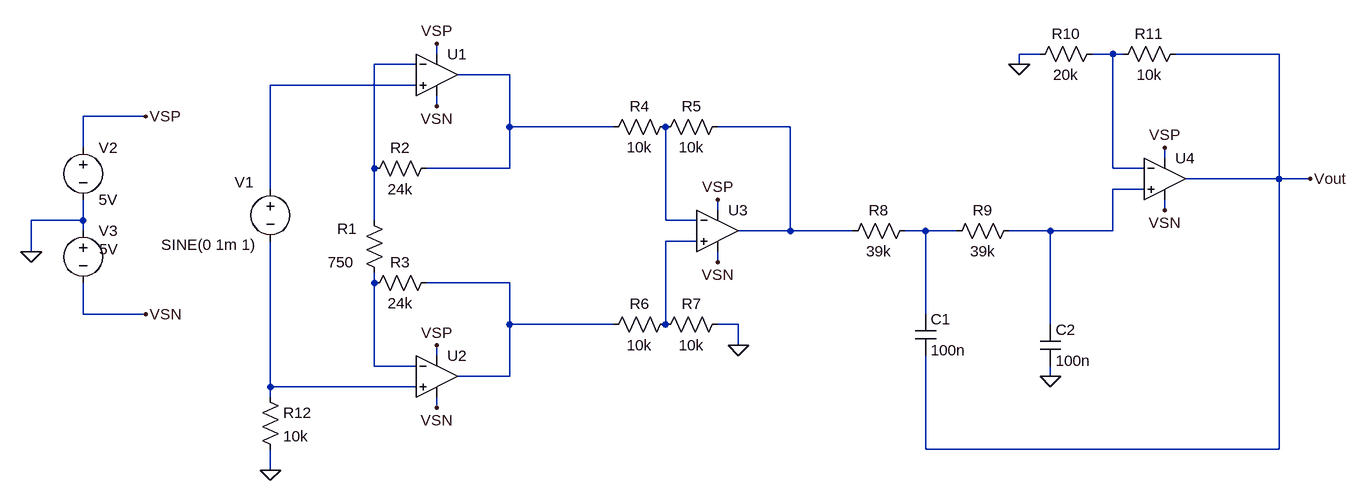
[diagram p0: schematic Schema_1.asc]
Schema_1.asc, the LTspice schematic file:
Version 4
SHEET 1 2040 680
WIRE 624 -48 624 -64
WIRE 1552 -48 1520 -48
WIRE 1664 -48 1632 -48
WIRE 1680 -48 1664 -48
WIRE 1920 -48 1760 -48
WIRE 592 -32 528 -32
WIRE 1520 -32 1520 -48
WIRE 736 -16 656 -16
WIRE 592 0 368 0
WIRE 624 32 624 16
WIRE 176 48 80 48
WIRE 736 64 736 -16
WIRE 896 64 736 64
WIRE 1168 64 1056 64
WIRE 80 96 80 48
WIRE 1744 112 1744 96
WIRE 528 128 528 -32
WIRE 736 128 736 64
WIRE 736 128 608 128
WIRE 1664 128 1664 -48
WIRE 1712 128 1664 128
WIRE 1920 144 1920 -48
WIRE 1920 144 1776 144
WIRE 1968 144 1920 144
WIRE 368 160 368 0
WIRE 1712 160 1664 160
WIRE 1056 192 1056 176
WIRE 1744 192 1744 176
WIRE 80 208 80 176
WIRE 80 208 0 208
WIRE 528 208 528 128
WIRE 976 208 976 64
WIRE 1024 208 976 208
WIRE 80 224 80 208
WIRE 1168 224 1168 64
WIRE 1168 224 1088 224
WIRE 1264 224 1168 224
WIRE 1376 224 1344 224
WIRE 1424 224 1376 224
WIRE 1568 224 1504 224
WIRE 1664 224 1664 160
WIRE 1664 224 1568 224
WIRE 1024 240 976 240
WIRE 0 256 0 208
WIRE 1056 272 1056 256
WIRE 528 304 528 288
WIRE 736 304 608 304
WIRE 80 352 80 304
WIRE 176 352 80 352
WIRE 1376 352 1376 224
WIRE 736 368 736 304
WIRE 896 368 736 368
WIRE 976 368 976 240
WIRE 1088 368 1056 368
WIRE 1568 368 1568 224
WIRE 1088 400 1088 368
WIRE 624 416 624 400
WIRE 528 432 528 304
WIRE 592 432 528 432
WIRE 736 448 736 368
WIRE 736 448 656 448
WIRE 1568 448 1568 432
WIRE 368 464 368 240
WIRE 592 464 368 464
WIRE 368 480 368 464
WIRE 624 496 624 480
WIRE 1376 560 1376 416
WIRE 1920 560 1920 144
WIRE 1920 560 1376 560
WIRE 368 592 368 560
FLAG 0 256 0
FLAG 176 48 VSP
FLAG 176 352 VSN
FLAG 368 592 0
FLAG 624 -64 VSP
FLAG 624 32 VSN
FLAG 624 400 VSP
FLAG 624 496 VSN
FLAG 1056 272 VSN
FLAG 1056 176 VSP
FLAG 1088 400 0
FLAG 1520 -32 0
FLAG 1744 192 VSN
FLAG 1744 96 VSP
FLAG 1968 144 Vout
FLAG 1568 448 0
SYMBOL voltage 80 208 R0
WINDOW 3 39 44 Center 2
WINDOW 123 0 0 Left 0
WINDOW 39 0 0 Left 0
SYMATTR InstName V3
SYMATTR Value 5V
SYMBOL voltage 80 80 R0
WINDOW 123 0 0 Left 0
WINDOW 39 0 0 Left 0
SYMATTR InstName V2
SYMATTR Value 5V
SYMBOL voltage 368 144 R0
WINDOW 0 -55 5 Left 2
WINDOW 3 -22 101 Right 2
WINDOW 123 0 0 Left 0
WINDOW 39 0 0 Left 0
SYMATTR InstName V1
SYMATTR Value SINE(0 1m 1)
SYMBOL res 352 464 R0
SYMATTR InstName R12
SYMATTR Value 10k
SYMBOL OpAmps\\UniversalOpAmp2 624 -16 R0
SYMATTR InstName U1
SYMBOL OpAmps\\UniversalOpAmp2 624 448 R0
SYMATTR InstName U2
SYMBOL res 512 192 R0
WINDOW 0 -41 29 Left 2
WINDOW 3 -56 80 Left 2
SYMATTR InstName R1
SYMATTR Value 750
SYMBOL res 512 320 R270
WINDOW 0 32 56 VTop 2
WINDOW 3 0 56 VBottom 2
SYMATTR InstName R3
SYMATTR Value 24k
SYMBOL res 624 112 R90
WINDOW 0 0 56 VBottom 2
WINDOW 3 32 56 VTop 2
SYMATTR InstName R2
SYMATTR Value 24k
SYMBOL res 992 48 R90
WINDOW 0 0 56 VBottom 2
WINDOW 3 32 56 VTop 2
SYMATTR InstName R4
SYMATTR Value 10k
SYMBOL res 992 352 R90
WINDOW 0 0 56 VBottom 2
WINDOW 3 32 56 VTop 2
SYMATTR InstName R6
SYMATTR Value 10k
SYMBOL OpAmps\\UniversalOpAmp2 1056 224 R0
SYMATTR InstName U3
SYMBOL res 1072 48 R90
WINDOW 0 0 56 VBottom 2
WINDOW 3 32 56 VTop 2
SYMATTR InstName R5
SYMATTR Value 10k
SYMBOL res 1072 352 R90
WINDOW 0 0 56 VBottom 2
WINDOW 3 32 56 VTop 2
SYMATTR InstName R7
SYMATTR Value 10k
SYMBOL res 1360 208 R90
WINDOW 0 0 56 VBottom 2
WINDOW 3 32 56 VTop 2
SYMATTR InstName R8
SYMATTR Value 39k
SYMBOL res 1520 208 R90
WINDOW 0 0 56 VBottom 2
WINDOW 3 32 56 VTop 2
SYMATTR InstName R9
SYMATTR Value 39k
SYMBOL cap 1360 352 R0
SYMATTR InstName C1
SYMATTR Value 100n
SYMBOL res 1648 -64 R90
WINDOW 0 0 56 VBottom 2
WINDOW 3 32 56 VTop 2
SYMATTR InstName R10
SYMATTR Value 20k
SYMBOL res 1776 -64 R90
WINDOW 0 0 56 VBottom 2
WINDOW 3 32 56 VTop 2
SYMATTR InstName R11
SYMATTR Value 10k
SYMBOL OpAmps\\UniversalOpAmp2 1744 144 R0
SYMATTR InstName U4
SYMBOL cap 1552 368 R0
SYMATTR InstName C2
SYMATTR Value 100n

The netlist it stands for:
* Schema_1.asc
V3 0 VSN 5V
V2 VSP 0 5V
V1 N004 N012 SINE(0 1m 1)
R12 N012 0 10k
XU1 N004 N002 VSP VSN N003 level2 Avol=1Meg GBW=10Meg Slew=10Meg Ilimit=25m Rail=0 Vos=0 En=0 Enk=0 In=0 Ink=0 Rin=500Meg  ; pins In+ In- V+ V- OUT
XU2 N012 N010 VSP VSN N011 level2 Avol=1Meg GBW=10Meg Slew=10Meg Ilimit=25m Rail=0 Vos=0 En=0 Enk=0 In=0 Ink=0 Rin=500Meg  ; pins In+ In- V+ V- OUT
R1 N002 N010 750
R3 N010 N011 24k
R2 N003 N002 24k
R4 N007 N003 10k
R6 N009 N011 10k
XU3 N009 N007 VSP VSN N005 level2 Avol=1Meg GBW=10Meg Slew=10Meg Ilimit=25m Rail=0 Vos=0 En=0 Enk=0 In=0 Ink=0 Rin=500Meg  ; pins In+ In- V+ V- OUT
R5 N005 N007 10k
R7 0 N009 10k
R8 N008 N005 39k
R9 N006 N008 39k
C1 N008 Vout 100n
R10 N001 0 20k
R11 Vout N001 10k
XU4 N006 N001 VSP VSN Vout level2 Avol=1Meg GBW=10Meg Slew=10Meg Ilimit=25m Rail=0 Vos=0 En=0 Enk=0 In=0 Ink=0 Rin=500Meg  ; pins In+ In- V+ V- OUT
C2 N006 0 100n
.lib UniversalOpAmp2.lib
.backanno
.end